# Altium project DATA_LOGER-v0.PrjPcb
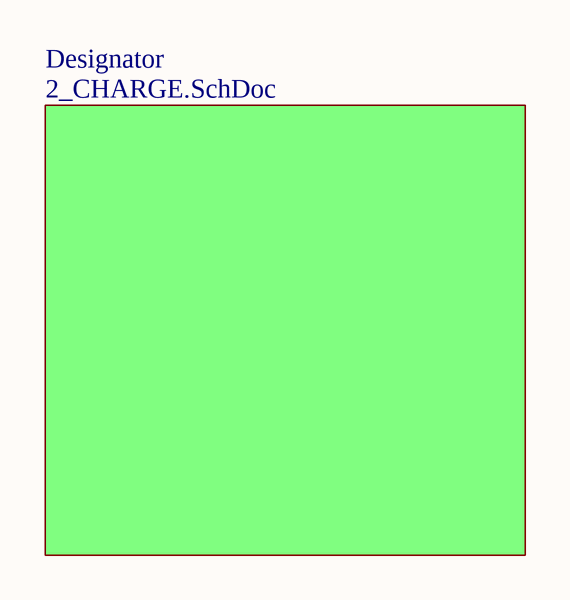
[diagram p0: 1_MAIN.SchDoc]
2 sheets, 34 parts. Net scope: flat (ports and power ports of the same name join across sheets).
Sheets:
  1_MAIN.SchDoc
    Designator = 2_CHARGE.SchDoc

## Sheet 1_MAIN.SchDoc
size A4; SheetNumber: 1; SheetTotal: 2

### Sub-sheets
Designator = 2_CHARGE.SchDoc: no entries

## Sheet 2_CHARGE.SchDoc
size A4; SheetNumber: 2; SheetTotal: 2
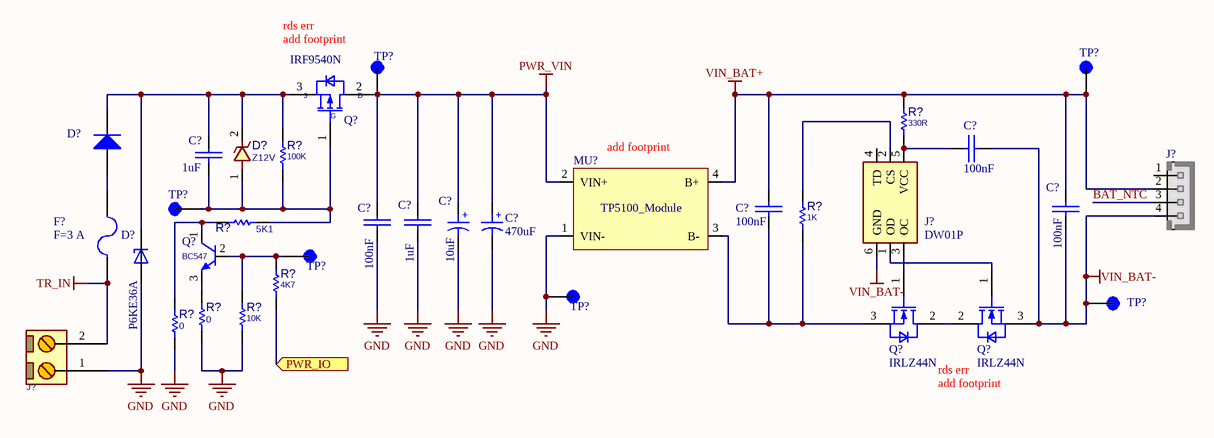
[diagram p1: 2_CHARGE.SchDoc]

### Parts
(Parts that share a designator on the sheet are numbered #1, #2 ... from top to bottom, then left to right.)
C?#1  100nF  [Cap - 100nF]
C?#2  1uF  [Cap - 100nF]
C?#3  100nF  [Cap - 100nF]
C?#4  100nF  [Cap - 100nF]
C?#5  100nF  [Cap - 100nF]
C?#6  1uF  [Cap - 100nF]
C?#7  10uF  [Cap electrolitic radial 10x20-5]
C?#8  470uF  [Cap electrolitic radial 10x20-5]
D?#1  (no value)  [Diode 1n4007]
D?#2  Z12V  [D_AX04_DO41]
D?#3  P6KE36A  [DIOAD1300W80L670D310]
F?  F=3 A  [Fuse 5x20 With holder pin]
J?#1  HHDR_4  [XH_4]  (value not drawn)
J?#2  DW01P  [SOT23-6]
J?#3  CONN_TB2  [TBB_2]  (value not drawn)
MU?  TP5100_Module
Q?#1  IRF9540N
Q?#2  BC547  [TO92_3]
Q?#3  IRLZ44N
Q?#4  IRLZ44N
R?#1  330R  [R025W_AX04]
R?#2  100K  [R025W_AX04]
R?#3  1K  [R025W_AX04]
R?#4  5K1  [R1206]
R?#5  4K7  [R025W_AX04]
R?#6  0  [R1206]
R?#7  10K  [R025W_AX04]
R?#8  0  [R1206]
TP?#1  5269  [KEYSTONE_5269]  (value not drawn)
TP?#2  5269  [KEYSTONE_5269]  (value not drawn)
TP?#3  5269  [KEYSTONE_5269]  (value not drawn)
TP?#4  5269  [KEYSTONE_5269]  (value not drawn)
TP?#5  5269  [KEYSTONE_5269]  (value not drawn)
TP?#6  5269  [KEYSTONE_5269]  (value not drawn)

### Ports
PWR_IO (in)

### Nets
GND: C?#5.2(-) C?#6.2(-) C?#7.2 C?#8.2 D?#3.A J?#3.1 MU?.1(VIN-) R?#6.1 R?#7.1 R?#8.1 TP?#5.TP
PWR_VIN: C?#5.1(+) C?#6.1(+) C?#7.1 C?#8.1 MU?.2(VIN+) Q?#1.2(DRAIN) TP?#1.TP
TR_IN: F?.1 J?#3.2
VIN_BAT+: C?#3.2(-) C?#4.2(-) J?#1.2 MU?.4(B+) R?#1.1 TP?#2.TP
VIN_BAT-: C?#1.1(+) C?#4.1(+) J?#1.4 J?#2.6(GND) Q?#4.3(SOURCE) TP?#6.TP
BAT_NTC: J?#1.3
NetC?#1_2: C?#1.2(-) J?#2.5(VCC) R?#1.2
NetC?#2_1: C?#2.1(+) D?#1.2(K) D?#2.2 D?#3.C Q?#1.3(SOURCE) R?#2.1
NetC?#2_2: C?#2.2(-) D?#2.1 Q?#1.1(GATE) R?#2.2 R?#4.2 TP?#3.TP
NetC?#3_1: C?#3.1(+) MU?.3(B-) Q?#3.3(SOURCE) R?#3.2
NetD?#1_1: D?#1.1(A) F?.2
NetJ?#2_1: J?#2.1(OD) Q?#4.1(GATE)
NetJ?#2_2: J?#2.2(CS) R?#3.1
NetJ?#2_3: J?#2.3(OC) Q?#3.1(GATE)
NetQ?#2_1: Q?#2.1(C) R?#4.1 R?#8.2
NetQ?#2_2: Q?#2.2(B) R?#5.1 R?#7.2 TP?#4.TP
NetQ?#2_3: Q?#2.3(E) R?#6.2
NetQ?#3_2: Q?#3.2(DRAIN) Q?#4.2(DRAIN)
NetR?#5_2: R?#5.2 ; port PWR_IO

Not connected (* = marked no-connect by the designer): J?#1 1; J?#2 4(TD)

### Notes on the sheet
- (near TP?#1) add footprint
- rds err
- (near Q?#1) S
- (near Q?#1) G
- (near Q?#1) D
- (near MU?) add footprint
- add footprint
- (near Q?#4) rds err
- (in symbol Cap electrolitic radial 10x21) +

### Library data of the parts
C?#1 C?#3-C?#5 = Cap-Bipolar_1: Bipolar Capacitor; Voltage: 100V; Designer: Saeid Jorablo; Organazation: ControTec; Adding Date: 1387/12/20; Value: 100nF
C?#2 C?#6 = Cap-Bipolar_1: Bipolar Capacitor; Voltage: 100V; Designer: Saeid Jorablo; Organazation: ControTec; Value: 100nF; Adding Date: 1387/12/20
C?#7 C?#8 = Cap electrolitic radial 10x21: Cap electrolitic radial; Part. No: 100U/50V; Designer: Abbas Basereh; Data: 16-12-2016
D?#1 = Diode: Published: 8-Jun-2000; LatestRevisionDate: 17-Jul-2002; LatestRevisionNote: Re-released for DXP Platform.; DatasheetVersion: 1997; Publisher: Altium Limited; PackageDescription: Diode, Axial; Body 3.8 x 1.9 mm (LxDia. max), Lead Dia. 0.53 mm (max); Code_JEDEC: DO-204-AH; ComponentLink1Description: Manufacturer Link; ComponentLink1URL: http://www.fairchildsemi.com/; ComponentLink2Description: Datasheet; ComponentLink2URL: http://www.fairchildsemi.com/ds/1N%2F1N4148.pdf
D?#2 = DIODE_THD_ZENER: DIODE, ZENER, 0.2W, 12V; MANF: Diodes; DESC: DESCRIPTION; PARAM: 15V; MANF_P#: ZENER15V; ASSEMBLY: ASSEMBLY; PRICE: PRICE; PARAM2: 0.2W; VALUE: Z12V
D?#3 = P6KE36A: TVS; Package: None; Price: None; Value: *; MP: P6KE36A; Availability: Unavailable
F? = Fuse 5x20 with holdeer pins: Fuses 5x20
J?#1 = XH_4: JST-XH pitch: 2.5mm; VALUE: HHDR_4
J?#2 = DW01P: One Cell Lithium-ion/Polymer Battery Protection IC; MF: Fortune; MP: DW01-P; SnapEDA_Link: https://www.snapeda.com/parts/DW01-P/Fortune+Semiconductor/view-part/?ref=snap; Package: None; Value: *; Check_prices: https://www.snapeda.com/parts/DW01-P/Fortune+Semiconductor/view-part/?ref=eda
J?#3 = CONN_TB2: CONN, TERMINAL BLOCK, 5.08mm pitch; VALUE: CONN_TB2
Q?#1 = IRF9540N: OptiMOS - P2 Power-Transistor, P-channel-Enhancement mode, VDS -30V; Manufacturer: Infineon Technologies; Manufacturer Order NumberManufacturer Order Number: IRF9540N; PackageReference: PG-TO220-3-904
Q?#2 = NPN_BC547_TO92: BJT, NPN, 45v, 0.1A, THD, TO92; PARAM: 0.1A, Hfe110~800; PARAM2: 45v, 500mW; MANF: FAIRCHILD; MANF_P#: BC547; VALUE: BC547
Q?#3 Q?#4 = IRLZ44N: OptiMOS 3 Power-Transistor, VDS 100V; Manufacturer: Infineon Technologies; Manufacturer Order Number: IRLZ44N; PackageReference: PG-TO220-3-904
R?#1-R?#3 R?#5 = RES_THD_1: RESISTOR, THD; MANF_P#: RK73H1ETTP4701F; MANF: KOA SPEER; PARAM: 0.063W; DESC: DESCRIPTION; DIST#: MOUSER; PARAM2: 1%; VALUE: 10K; ASSEMBLY: ASSEMBLY; PRICE: 100= 0.5$
R?#4 R?#6 R?#8 = RES_SMD_10: RESISTOR, SMD; PARAM: -W; DESC: DESCRIPTION; DIST#: MOUSER; PARAM2: 1%; MANF_P#: -; MANF: -; ASSEMBLY: ASSEMBLY; PRICE: 100= 0.5$
R?#7 = RES_THD_1: RESISTOR, THD; MANF_P#: RK73H1ETTP4701F; MANF: KOA SPEER; PARAM: 0.063W; DESC: DESCRIPTION; DIST#: MOUSER; PARAM2: 1%; ASSEMBLY: ASSEMBLY; PRICE: 100= 0.5$; VALUE: 10K
TP?#1-TP?#6 = 5269: TEST POINT (PURPLE) - MINIATURE; MF: Keystone Electronics; SnapEDA_Link: https://www.snapeda.com/parts/5269/Keystone/view-part/?ref=snap; Package: None; Value: *; MP: 5269; Check_prices: https://www.snapeda.com/parts/5269/Keystone/view-part/?ref=eda